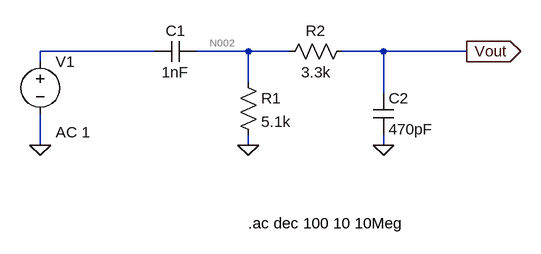
[diagram p0: schematic BandpassFilters.asc]
BandpassFilters.asc, the LTspice schematic file:
Version 4.1
SHEET 1 880 680
WIRE 144 96 -32 96
WIRE 288 96 208 96
WIRE 352 96 288 96
WIRE 496 96 432 96
WIRE 624 96 496 96
WIRE -32 112 -32 96
WIRE 288 144 288 96
WIRE 496 160 496 96
WIRE -32 240 -32 192
WIRE 288 240 288 224
WIRE 496 240 496 224
FLAG 288 240 0
FLAG 496 240 0
FLAG 624 96 Vout
IOPIN 624 96 Out
FLAG -32 240 0
SYMBOL cap 480 160 R0
SYMATTR InstName C2
SYMATTR Value 470pF
SYMBOL voltage -32 96 R0
WINDOW 123 24 124 Left 2
WINDOW 39 0 0 Left 0
SYMATTR InstName V1
SYMATTR Value ""
SYMATTR Value2 AC 1
SYMBOL cap 208 80 R90
WINDOW 0 0 32 VBottom 2
WINDOW 3 32 32 VTop 2
SYMATTR InstName C1
SYMATTR Value 1nF
SYMBOL res 272 128 R0
SYMATTR InstName R1
SYMATTR Value 5.1k
SYMBOL res 448 80 R90
WINDOW 0 0 56 VBottom 2
WINDOW 3 32 56 VTop 2
SYMATTR InstName R2
SYMATTR Value 3.3k
TEXT 288 360 Left 2 !.ac dec 100 10 10Meg

The netlist it stands for:
* BandpassFilters.asc
C2 Vout 0 470pF
V1 N001 0 AC 1
C1 N002 N001 1nF
R1 N002 0 5.1k
R2 Vout N002 3.3k
.ac dec 100 10 10Meg
.backanno
.end

* Results of the author's LTspice run, read from the files saved beside the schematic
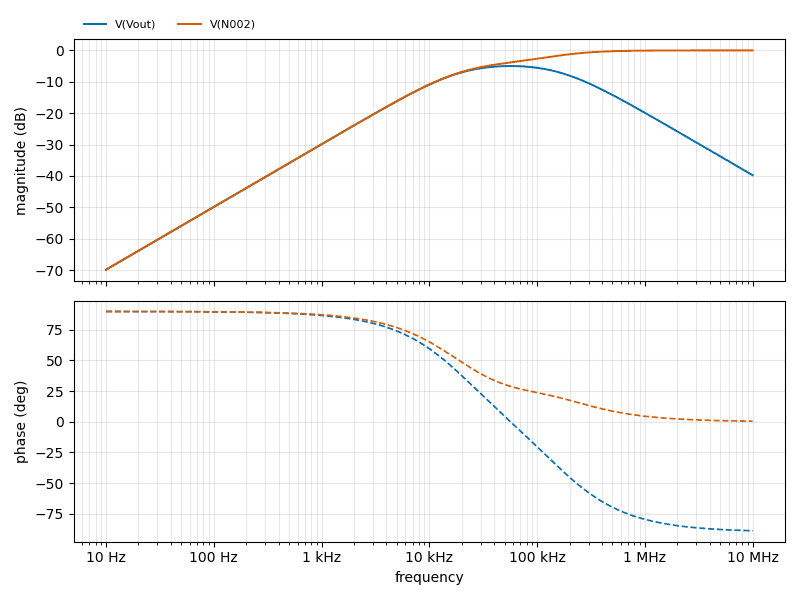
[diagram p1: AC Analysis of BandpassFilters.asc, plotted from the saved traces]
* AC Analysis, 1 run:
*   V(Vout): -69.89 dB at 10 Hz, -39.78 dB at 10 MHz, peak -4.98 dB at 56.23 kHz, 3 dB below the peak at 16.16 kHz and 198.2 kHz
*   V(N002): -69.89 dB at 10 Hz, -0.00 dB at 10 MHz, peak -0.00 dB at 10 MHz, 3 dB below the peak at 84.34 kHz